# EAGLE design OV7670_VGA_FPGA_board (EAGLE 9.6.2)
COMPANY: Adafruit Industries; DRAWN: KTOWN; REV: A; YEAR: 2018

## Sheet 1 of 2
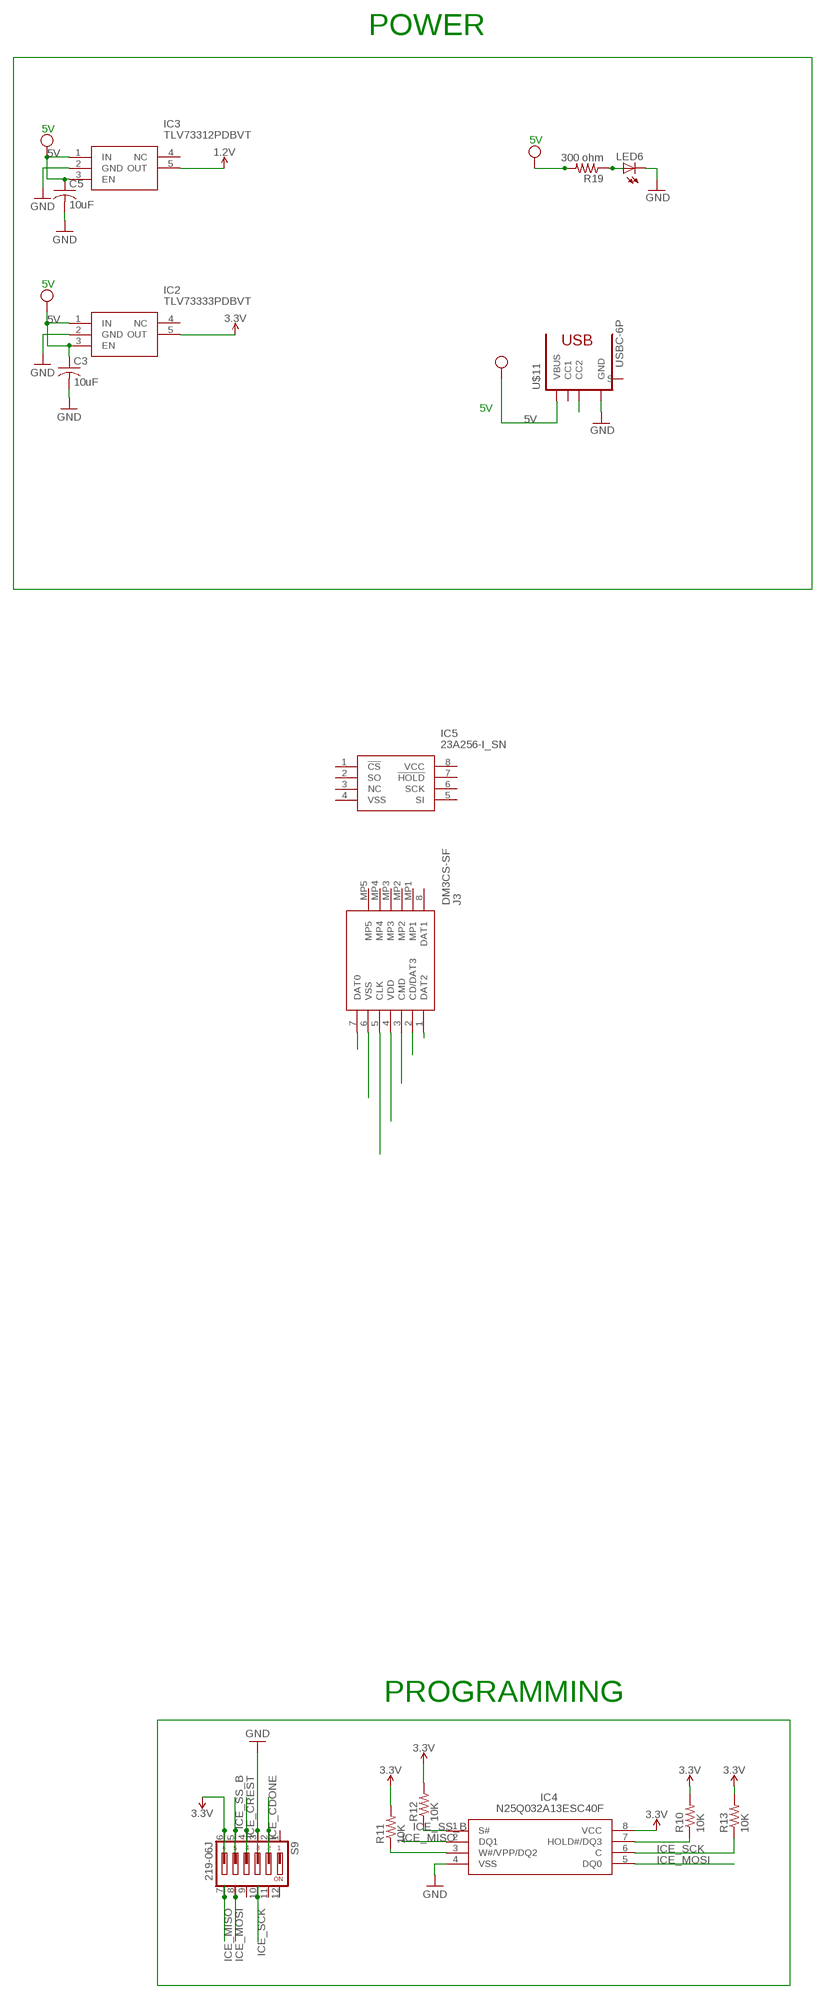
[diagram p0: schematic, sheet 1, part 1 of 3]
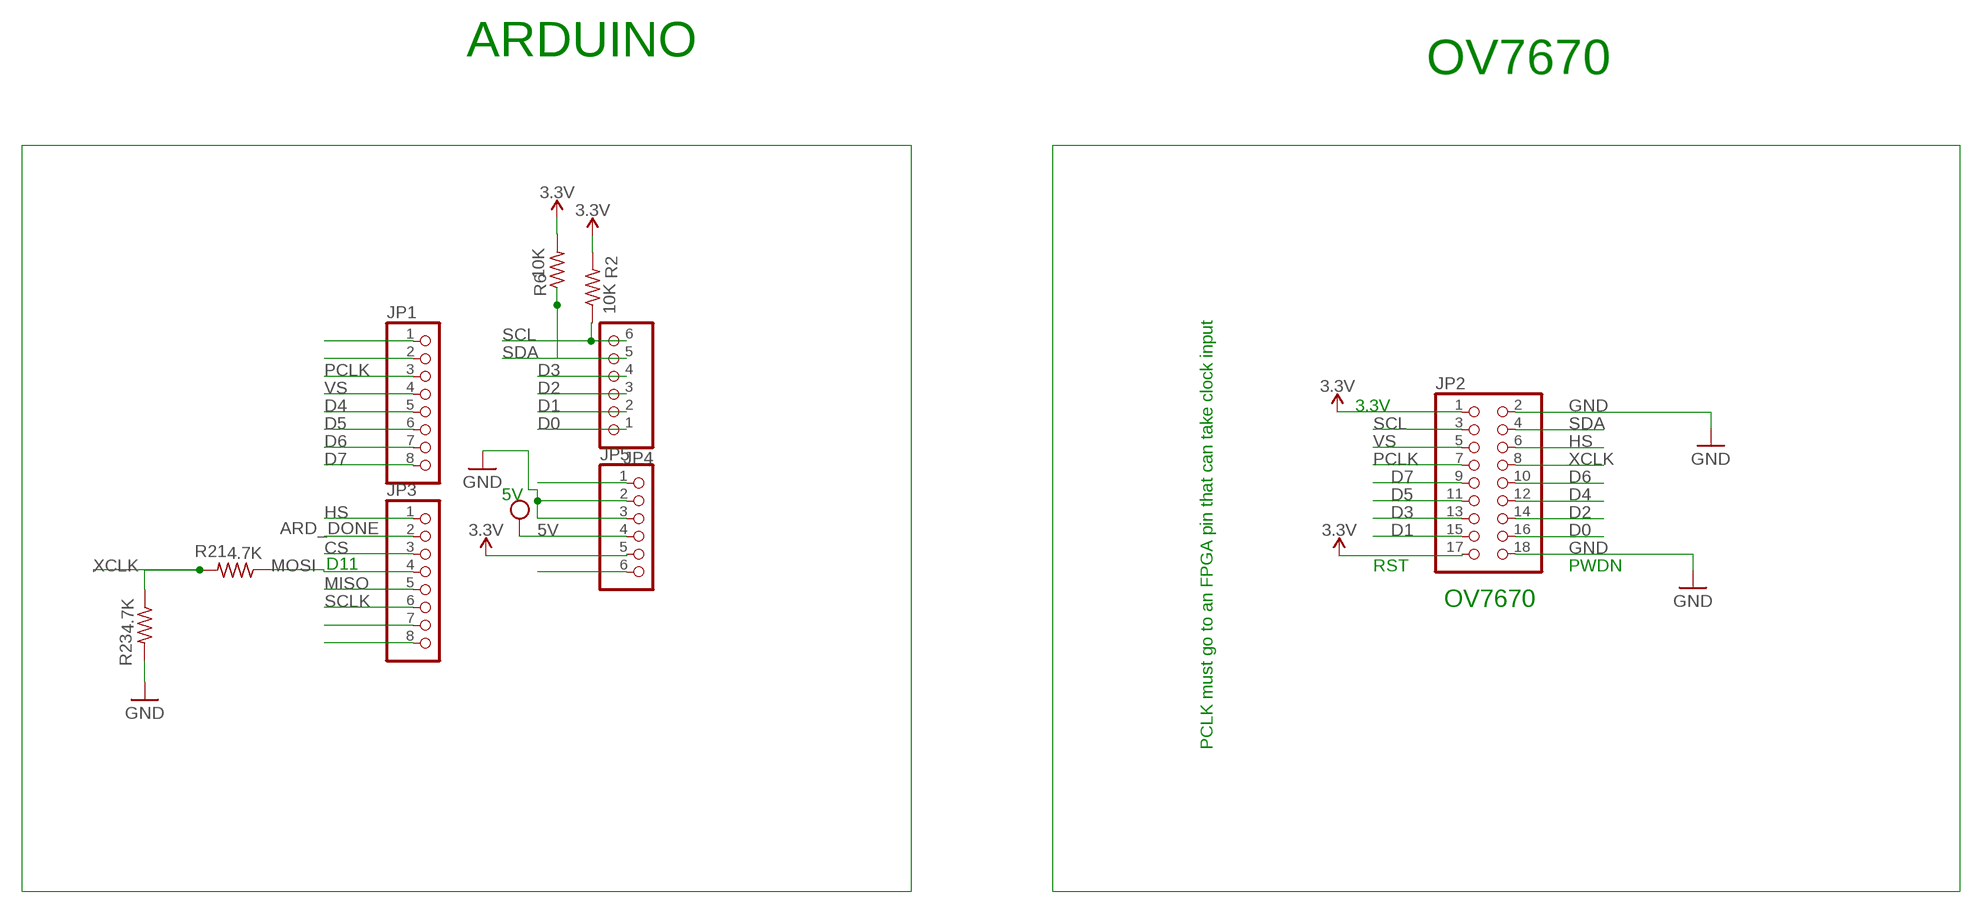
[diagram p1: schematic, sheet 1, part 2 of 3]
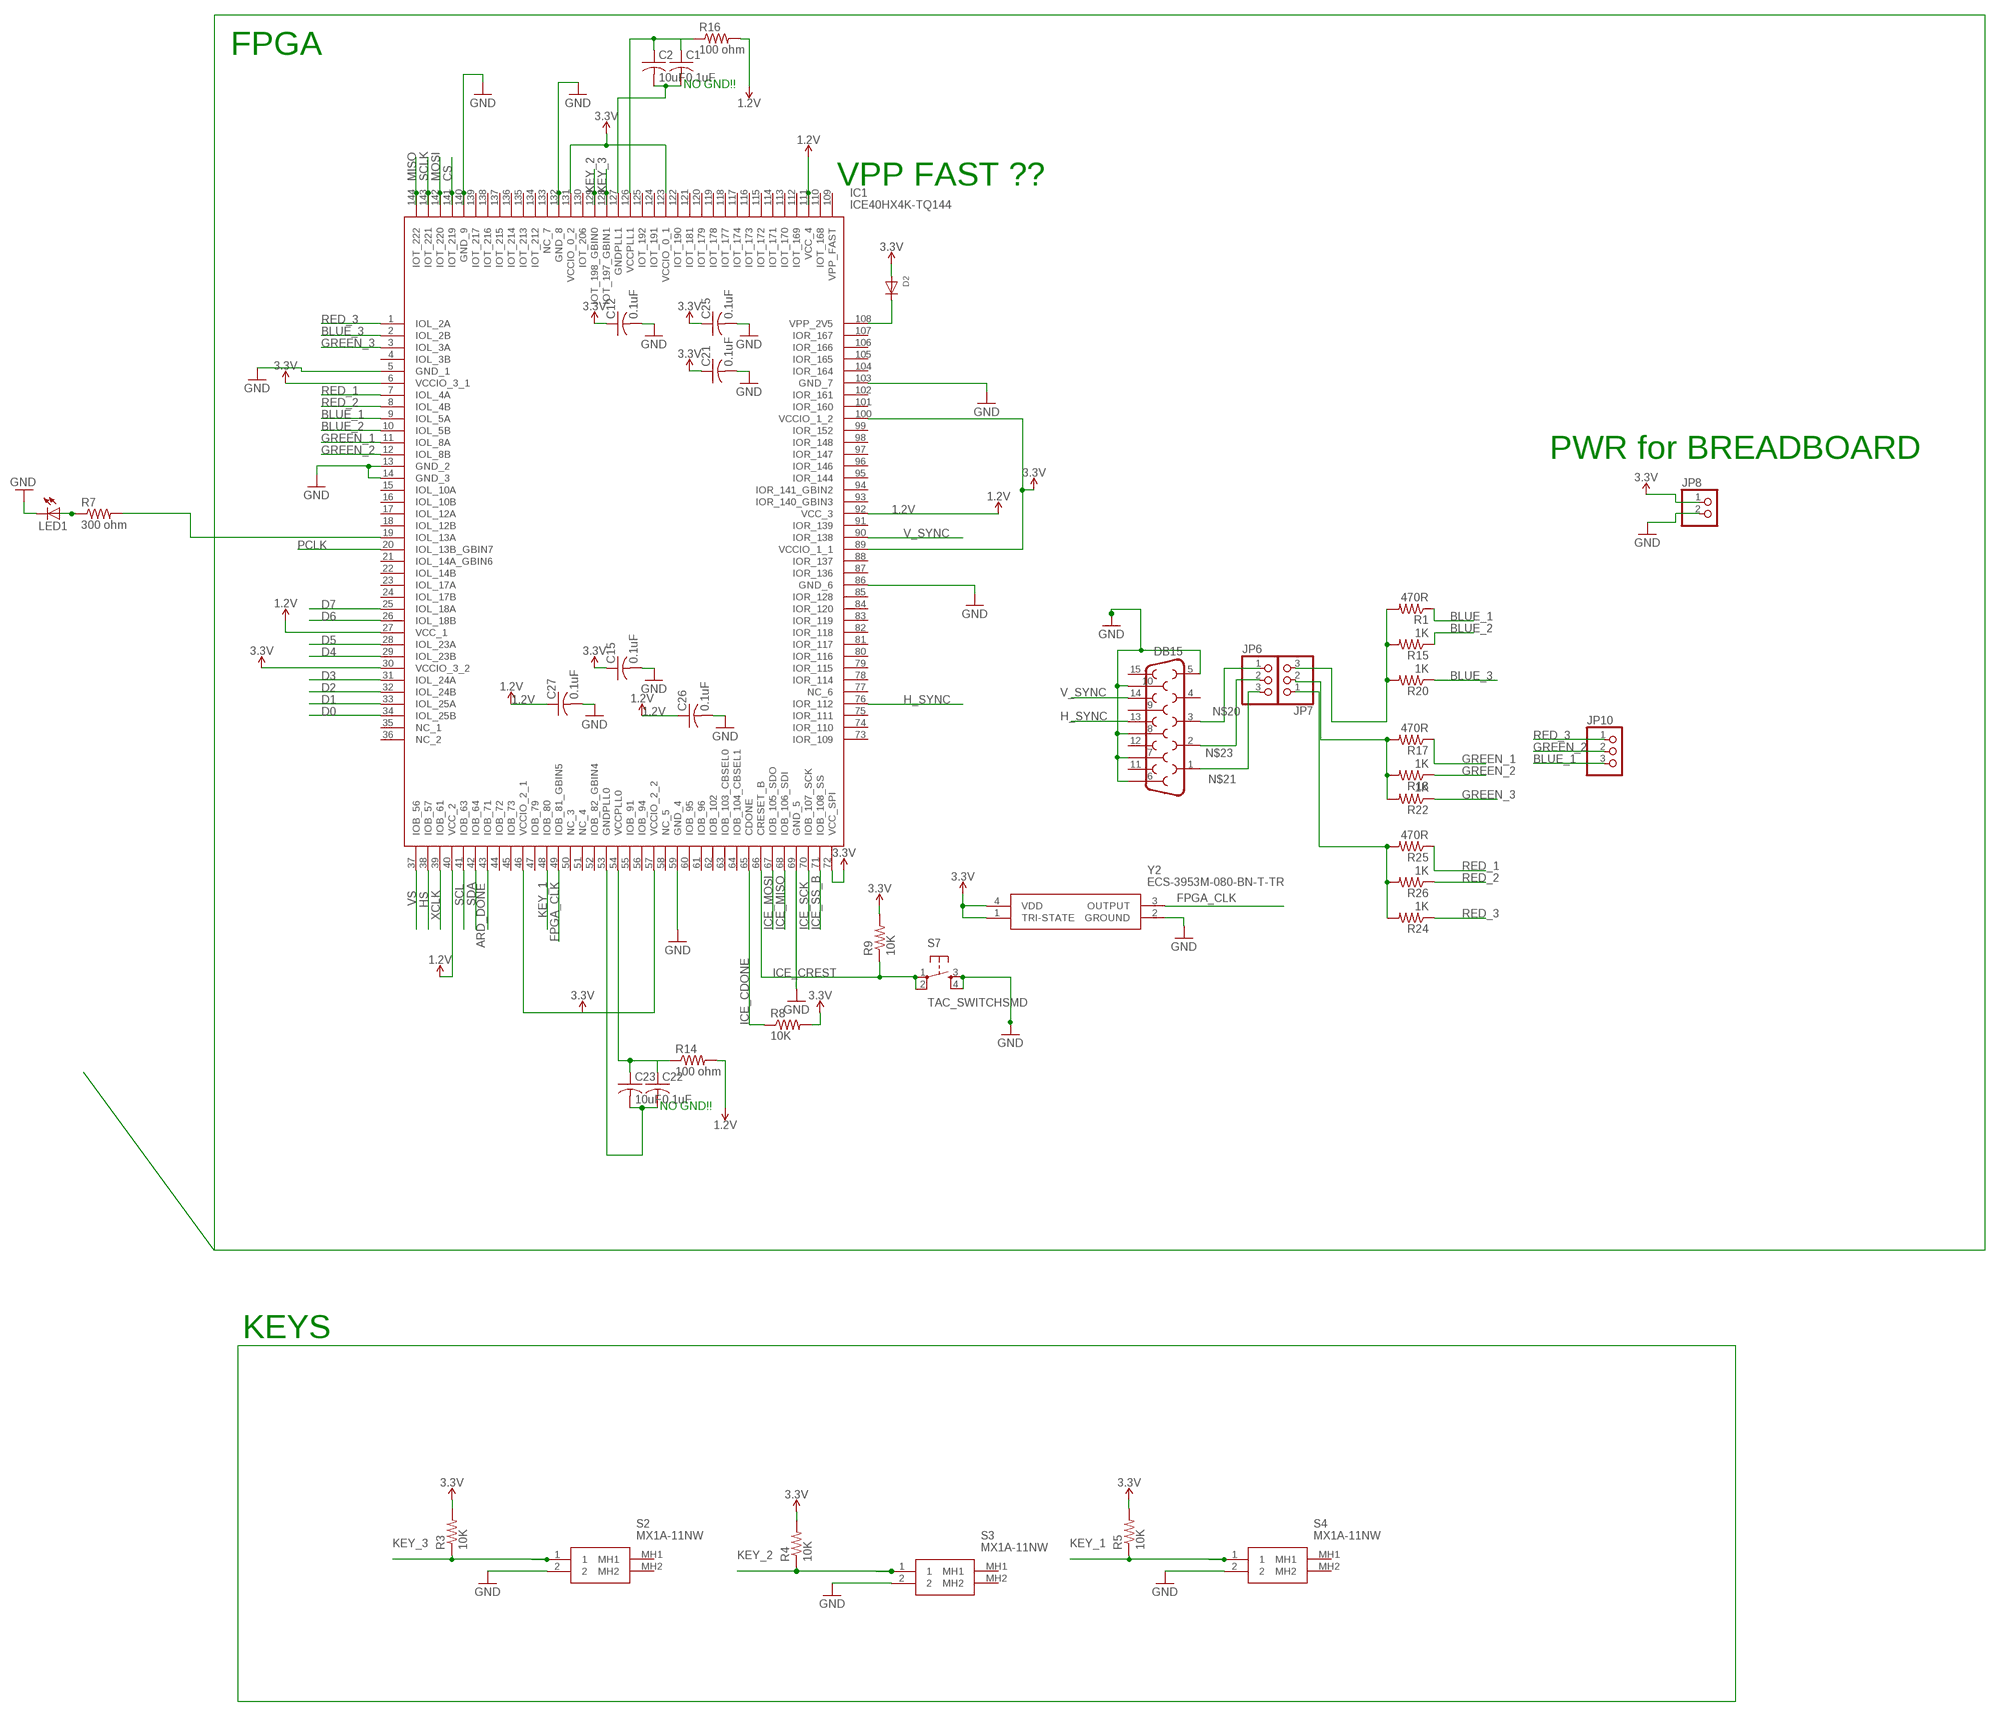
[diagram p2: schematic, sheet 1, part 3 of 3]

### Parts
C1  0.1uF  C-USC0805  [C0805]
C2  10uF  C-USC0805  [C0805]
C3  10uF  C-USC0805  [C0805]
C5  10uF  C-USC0805  [C0805]
C12  0.1uF  C-USC0805  [C0805]
C15  0.1uF  C-USC0805  [C0805]
C21  0.1uF  C-USC0805  [C0805]
C22  0.1uF  C-USC0805  [C0805]
C23  10uF  C-USC0805  [C0805]
C25  0.1uF  C-USC0805  [C0805]
C26  0.1uF  C-USC0805  [C0805]
C27  0.1uF  C-USC0805  [C0805]
D2  DIODESOD-323F  [SOD-323F]
IC1  ICE40HX4K-TQ144  [QFP50P2200X2200X160-144N]
IC2  TLV73333PDBVT  [SOT95P280X145-5N]
IC3  TLV73312PDBVT  [SOT95P280X145-5N]
IC4  N25Q032A13ESC40F  [SOIC127P600X175-8N]
IC5  23A256-I_SN  [SOIC127P600X175-8N]
J3  DM3CS-SF  [DM3CSSF]
JP1  PINHD-1X8CLEANBIG  [1X08-CLEANBIG]
JP2  PINHD-2X9/90  [2X09/90]
JP3  PINHD-1X8CLEANBIG  [1X08-CLEANBIG]
JP4  PINHD-1X6CB  [1X06-CLEANBIG]
JP5  PINHD-1X6CB  [1X06-CLEANBIG]
JP6  PINHD-1X3  [1X03]
JP7  PINHD-1X3  [1X03]
JP8  PINHD-1X2  [1X02]
JP10  PINHD-1X3  [1X03]
LED1  LEDCHIPLED_0805  [CHIPLED_0805]
LED6  LEDCHIPLED_0805  [CHIPLED_0805]
R1  470R  R-US_R0805  [R0805]
R2  10K  R-US_R0805  [R0805]
R3  10K  R-US_R0805  [R0805]
R4  10K  R-US_R0805  [R0805]
R5  10K  R-US_R0805  [R0805]
R6  10K  R-US_R0805  [R0805]
R7  300 ohm  R-US_R0805  [R0805]
R8  10K  R-US_R0805  [R0805]
R9  10K  R-US_R0805  [R0805]
R10  10K  R-US_R0805  [R0805]
R11  10K  R-US_R0805  [R0805]
R12  10K  R-US_R0805  [R0805]
R13  10K  R-US_R0805  [R0805]
R14  100 ohm  R-US_R0805  [R0805]
R15  1K  R-US_R0805  [R0805]
R16  100 ohm  R-US_R0805  [R0805]
R17  470R  R-US_R0805  [R0805]
R18  1K  R-US_R0805  [R0805]
R19  300 ohm  R-US_R0805  [R0805]
R20  1K  R-US_R0805  [R0805]
R21  4.7K  R-US_R0805  [R0805]
R22  1K  R-US_R0805  [R0805]
R23  4.7K  R-US_R0805  [R0805]
R24  1K  R-US_R0805  [R0805]
R25  470R  R-US_R0805  [R0805]
R26  1K  R-US_R0805  [R0805]
S2  MX1A-11NW  [MX1A11NW]
S3  MX1A-11NW  [MX1A11NW]
S4  MX1A-11NW  [MX1A11NW]
S7  TAC_SWITCHSMD  [TACTILE-SWITCH-SMD]
S9  219-06J  [CTS-219-06J]
U$1  DB15  [DB15]
U$11  USBC-6P  [USCX-06FX-XXMX-01]
Y2  ECS-3953M-080-BN-T-TR  [ECS3953M080BNTTR]

### Nets
1.2V: C26.1 C27.1 IC1.27(VCC_1) IC1.40(VCC_2) IC1.92(VCC_3) IC1.111(VCC_4) IC3.5(OUT) R14.2 R16.2
3.3V: C12.1 C15.1 C21.1 C25.1 D2.A IC1.6(VCCIO_3_1) IC1.30(VCCIO_3_2) IC1.46(VCCIO_2_1) IC1.57(VCCIO_2_2) IC1.72(VCC_SPI) IC1.89(VCCIO_1_1) IC1.100(VCCIO_1_2) IC1.123(VCCIO_0_1) IC1.131(VCCIO_0_2) IC2.5(OUT) IC4.8(VCC) JP2.1 JP2.17 JP5.5 JP8.1 R2.2 R3.2 R4.2 R5.2 R6.2 R8.2 R9.2 R10.2 R11.2 R12.2 R13.2 S9.6 Y2.1(TRI-STATE) Y2.4(VDD)
3.3V1: J3.4(VDD)
5V: C3.1 C5.1 IC2.1(IN) IC2.3(EN) IC3.1(IN) IC3.3(EN) JP5.4 R19.2 U$11.VBUS1(VBUS) U$11.VBUS2(VBUS) ; supply symbol labelled VCC
ARD_DONE: IC1.43(IOB_71) JP3.2
BLUE: JP7.3 R1.2 R15.2 R20.2
BLUE_1: IC1.9(IOL_5A) JP10.3 R1.1
BLUE_2: IC1.10(IOL_5B) R15.1
BLUE_3: IC1.2(IOL_2B) R20.1
CMD: J3.3(CMD)
CS: IC1.141(IOT_219) JP3.3
D0: IC1.34(IOL_25B) JP2.16 JP4.1
D1: IC1.33(IOL_25A) JP2.15 JP4.2
D2: IC1.32(IOL_24B) JP2.14 JP4.3
D3: IC1.31(IOL_24A) JP2.13 JP4.4
D4: IC1.29(IOL_23B) JP1.5 JP2.12
D5: IC1.28(IOL_23A) JP1.6 JP2.11
D6: IC1.26(IOL_18B) JP1.7 JP2.10
D7: IC1.25(IOL_18A) JP1.8 JP2.9
DAT0: J3.7(DAT0)
DAT2: J3.1(DAT2)
DAT3: J3.2(CD/DAT3)
FPGA_CLK: IC1.49(IOB_81_GBIN5) Y2.3(OUTPUT)
GND: C3.2 C5.2 C12.2 C15.2 C21.2 C25.2 C26.2 C27.2 IC1.5(GND_1) IC1.13(GND_2) IC1.14(GND_3) IC1.59(GND_4) IC1.69(GND_5) IC1.86(GND_6) IC1.103(GND_7) IC1.132(GND_8) IC1.140(GND_9) IC2.2(GND) IC3.2(GND) IC4.4(VSS) JP2.2 JP2.18 JP5.2 JP5.3 JP8.2 LED1.C LED6.C R23.2 S2.2 S3.2 S4.2 S7.3 S7.4 S9.3 U$1.5 U$1.6 U$1.7 U$1.8 U$1.10 U$11.GND1(GND) U$11.GND2(GND) Y2.2(GROUND)
GND1: J3.6(VSS)
GREEN: JP7.2 R17.2 R18.2 R22.2
GREEN_1: IC1.11(IOL_8A) R17.1
GREEN_2: IC1.12(IOL_8B) JP10.2 R18.1
GREEN_3: IC1.3(IOL_3A) R22.1
H_SYNC: IC1.76(IOR_112) U$1.13
HS: IC1.38(IOB_57) JP2.6 JP3.1
ICE_CDONE: IC1.65(CDONE) R8.1 S9.2
ICE_CREST: IC1.66(CRESET_B) R9.1 S7.1 S7.2 S9.4
ICE_MISO: IC1.68(IOB_106_SDI) IC4.2(DQ1) S9.7
ICE_MOSI: IC1.67(IOB_105_SDO) IC4.5(DQ0) S9.8
ICE_SCK: IC1.70(IOB_107_SCK) IC4.6(C) R13.1 S9.10
ICE_SS_B: IC1.71(IOB_108_SS) IC4.1(S#) R12.1 S9.5
KEY_1: IC1.48(IOB_80) R5.1 S4.1
KEY_2: IC1.129(IOT_198_GBIN0) R4.1 S3.1
KEY_3: IC1.128(IOT_197_GBIN1) R3.1 S2.1
MISO: IC1.144(IOT_222) JP3.5
MOSI: IC1.142(IOT_220) JP3.4 R21.1
N$1: IC4.7(HOLD#/DQ3) R10.1
N$2: LED6.A R19.1
N$4: IC4.3(W#/VPP/DQ2) R11.1
N$7: JP1.1
N$9: C22.1 C23.1 IC1.54(VCCPLL0) R14.1
N$10: JP1.2
N$11: LED1.A R7.1
N$12: IC1.19(IOL_13A) R7.2
N$13: D2.C IC1.108(VPP_2V5)
N$20: JP6.1 U$1.3
N$21: JP6.3 U$1.1
N$22: C1.1 C2.1 IC1.126(VCCPLL1) R16.1
N$23: JP6.2 U$1.2
N$25: C1.2 C2.2 IC1.127(GNDPLL1)
N$26: C22.2 C23.2 IC1.53(GNDPLL0)
N$27: U$11.CC2
N$34: JP3.7
N$36: JP3.8
N$37: JP5.1
N$44: JP5.6
PCLK: IC1.20(IOL_13B_GBIN7) JP1.3 JP2.7
RED: JP7.1 R24.2 R25.2 R26.2
RED_1: IC1.7(IOL_4A) R25.1
RED_2: IC1.8(IOL_4B) R26.1
RED_3: IC1.1(IOL_2A) JP10.1 R24.1
SCL: IC1.41(IOB_63) JP2.3 JP4.6 R2.1
SCLK: IC1.143(IOT_221) JP3.6
SD_CLK: J3.5(CLK)
SDA: IC1.42(IOB_64) JP2.4 JP4.5 R6.1
V_SYNC: IC1.90(IOR_138) U$1.14
VS: IC1.37(IOB_56) JP1.4 JP2.5
XCLK: IC1.39(IOB_61) JP2.8 R21.2 R23.1
Unconnected: IC1.4(IOL_3B) IC1.15(IOL_10A) IC1.16(IOL_10B) IC1.17(IOL_12A) IC1.18(IOL_12B) IC1.21(IOL_14A_GBIN6) IC1.22(IOL_14B) IC1.23(IOL_17A) IC1.24(IOL_17B) IC1.35(NC_1) IC1.36(NC_2) IC1.44(IOB_72) IC1.45(IOB_73) IC1.47(IOB_79) IC1.50(NC_3) IC1.51(NC_4) IC1.52(IOB_82_GBIN4) IC1.55(IOB_91) IC1.56(IOB_94) IC1.58(NC_5) IC1.60(IOB_95) IC1.61(IOB_96) IC1.62(IOB_102) IC1.63(IOB_103_CBSEL0) IC1.64(IOB_104_CBSEL1) IC1.73(IOR_109) IC1.74(IOR_110) IC1.75(IOR_111) IC1.77(NC_6) IC1.78(IOR_114) IC1.79(IOR_115) IC1.80(IOR_116) IC1.81(IOR_117) IC1.82(IOR_118) IC1.83(IOR_119) IC1.84(IOR_120) IC1.85(IOR_128) IC1.87(IOR_136) IC1.88(IOR_137) IC1.91(IOR_139) IC1.93(IOR_140_GBIN3) IC1.94(IOR_141_GBIN2) IC1.95(IOR_144) IC1.96(IOR_146) IC1.97(IOR_147) IC1.98(IOR_148) IC1.99(IOR_152) IC1.101(IOR_160) IC1.102(IOR_161) IC1.104(IOR_164) IC1.105(IOR_165) IC1.106(IOR_166) IC1.107(IOR_167) IC1.109(VPP_FAST) IC1.110(IOT_168) IC1.112(IOT_169) IC1.113(IOT_170) IC1.114(IOT_171) IC1.115(IOT_172) IC1.116(IOT_173) IC1.117(IOT_174) IC1.118(IOT_177) IC1.119(IOT_178) IC1.120(IOT_179) IC1.121(IOT_181) IC1.122(IOT_190) IC1.124(IOT_191) IC1.125(IOT_192) IC1.130(IOT_206) IC1.133(NC_7) IC1.134(IOT_212) IC1.135(IOT_213) IC1.136(IOT_214) IC1.137(IOT_215) IC1.138(IOT_216) IC1.139(IOT_217) IC2.4(NC) IC3.4(NC) IC5.1(!CS) IC5.2(SO) IC5.3(NC) IC5.4(VSS) IC5.5(SI) IC5.6(SCK) IC5.7(!HOLD) IC5.8(VCC) J3.8(DAT1) J3.MP1 J3.MP2 J3.MP3 J3.MP4 J3.MP5 S2.MH1 S2.MH2 S3.MH1 S3.MH2 S4.MH1 S4.MH2 S9.1 S9.9 S9.11 S9.12 U$1.4 U$1.9 U$1.11 U$1.12 U$1.15 U$11.CC1 U$11.SHIELD1(S) U$11.SHIELD2(S) U$11.SHIELD3(S) U$11.SHIELD4(S)

### Notes on the sheet
- POWER
- ARDUINO
- OV7670
- 5V
- 5V
- 5V
- 3.3V
- 5V
- D11 | RST | PWDN
- 5V
- OV7670
- PCLK must go to an FPGA pin that can take clock input
- FPGA
- NO GND!!
- VPP FAST ??
- PWR for BREADBOARD
- NO GND!!
- PROGRAMMING
- KEYS

## Sheet 2 of 2

## Library data of the parts
C1-C3 C5 C12 C15 C21-C23 C25-C27 = adafruit:C-US: CAPACITOR, American symbol
D2 = adafruit:DIODE: Diode SMADIODE - SMA Surface Mount Package 20V 1A Schottky Diode Digikey: 641-1014-6-ND DO-1N4148 - Through Hole Small Current Diode SOD-123 20V 1 A (.5mV Vf) Schottky Diode - Digikey: MBRX120TPMSCT-ND SOD-323 10V 570mA (.38mV Vf, 3ns) Schottky Diode - Digikey: ZLLS410CT-ND SOD-523 30V 30mA Schottky Diode (RB751S-40TE61) - Digikey: RB751S-40TE61CT-ND SOT23-R/W - SOT23 Package (R = Solder Paste/Reflow Ovens, W = Hand-Soldering) BAT54Film 40V 300mA - Digikey: 497-7162-1-ND
IC1 = iCE40HX4K-TQ144:ICE40HX4K-TQ144: FPGA - Field Programmable Gate Array Source: Datasheet <https://componentsearchengine.com/Datasheets/1/iCE40HX4K-TQ144.pdf>; DESCRIPTION: FPGA - Field Programmable Gate Array; HEIGHT: 1.6mm; MANUFACTURER_NAME: Lattice Semiconductor; MANUFACTURER_PART_NUMBER: iCE40HX4K-TQ144; MOUSER_PART_NUMBER: 842-ICE40HX4K-TQ144; MOUSER_PRICE-STOCK: https://www.mouser.co.uk/ProductDetail/Lattice/iCE40HX4K-TQ144?qs=F9A14TELRMvGNTZXkNDuOw%3D%3D
IC2 = TLV73333PDBVT:TLV73333PDBVT: Capacitor-free 300-mA low-dropout (LDO) regulator with foldback current limit for portable devices Source: Datasheet <http://www.ti.com/lit/ds/symlink/tlv733p.pdf>; DESCRIPTION: Capacitor-free 300-mA low-dropout (LDO) regulator with foldback current limit for portable devices; HEIGHT: 1.45mm; MANUFACTURER_NAME: Texas Instruments; MANUFACTURER_PART_NUMBER: TLV73333PDBVT; MOUSER_PART_NUMBER: 595-TLV73333PDBVT; MOUSER_PRICE-STOCK: https://www.mouser.co.uk/ProductDetail/Texas-Instruments/TLV73333PDBVT?qs=ifm8N2Kdrcam8xfmi4tOsQ%3D%3D
IC3 = TLV73312PDBVT:TLV73312PDBVT: Capacitor-free 300-mA low-dropout (LDO) regulator with foldback current limit for portable devices Source: Datasheet <http://www.ti.com/lit/gpn/TLV733P>; DESCRIPTION: Capacitor-free 300-mA low-dropout (LDO) regulator with foldback current limit for portable devices; HEIGHT: 1.45mm; MANUFACTURER_NAME: Texas Instruments; MANUFACTURER_PART_NUMBER: TLV73312PDBVT; MOUSER_PART_NUMBER: 595-TLV73312PDBVT; MOUSER_PRICE-STOCK: https://www.mouser.co.uk/ProductDetail/Texas-Instruments/TLV73312PDBVT?qs=ifm8N2KdrcbA2G38xADqCw%3D%3D
IC4 = N25Q032A13ESC40F:N25Q032A13ESC40F: FLASH - NOR Memory IC 32Mb (8M x 4) SPI 108MHz 8-SO Source: Datasheet <https://media-www.micron.com/-/media/client/global/documents/products/data-sheet/nor-flash/serial-nor/n25q/n25q_32mb_3v_65nm.pdf?rev=27fc6016fc5249adb4bb8f221e72b395>; DESCRIPTION: FLASH - NOR Memory IC 32Mb (8M x 4) SPI 108MHz 8-SO; HEIGHT: 1.75mm; MANUFACTURER_NAME: Alliance Memory; MANUFACTURER_PART_NUMBER: N25Q032A13ESC40F; MOUSER_PART_NUMBER: 913-N25Q032A13ESC40F; MOUSER_PRICE-STOCK: https://www.mouser.co.uk/ProductDetail/Alliance-Memory/N25Q032A13ESC40F?qs=W%2FMpXkg%252BdQ70%2FmLJsMq3Ww%3D%3D
IC5 = 23A256-I_SN:23A256-I_SN: 256K,32K X 8 1.7V Ser SRAM,23A256-I/SN Source: Datasheet <https://componentsearchengine.com/Datasheets/1/23A256-I_SN.pdf>; DESCRIPTION: 256K,32K X 8 1.7V Ser SRAM,23A256-I/SN; HEIGHT: 1.75mm; MANUFACTURER_NAME: Microchip; MANUFACTURER_PART_NUMBER: 23A256-I/SN; MOUSER_PART_NUMBER: 579-23A256-I/SN; MOUSER_PRICE-STOCK: https://www.mouser.com/Search/Refine.aspx?Keyword=579-23A256-I%2FSN
J3 = DM3CS-SF:DM3CS-SF: Memory Card Connectors 8P R/A SMT MICRO SD HINGE PUSH-PULL Source: Datasheet <https://datasheet.lcsc.com/szlcsc/Hirose-HRS-DM3CS-SF_C202111.pdf>; DESCRIPTION: Memory Card Connectors 8P R/A SMT MICRO SD HINGE PUSH-PULL; HEIGHT: 1.83mm; MANUFACTURER_NAME: Hirose; MANUFACTURER_PART_NUMBER: DM3CS-SF; MOUSER_PART_NUMBER: 798-DM3CSSF; MOUSER_PRICE-STOCK: https://www.mouser.co.uk/ProductDetail/Hirose-Connector/DM3CS-SF?qs=tTj%252BmQ3KZwbB9K5zh89Rcw%3D%3D
JP1 JP3 = adafruit:PINHD-1X8: PIN HEADER
JP2 = pinhead:PINHD-2X9: PIN HEADER
JP4 JP5 = adafruit:PINHD-1X6: PIN HEADER
JP6 JP7 JP10 = adafruit:PINHD-1X3: PIN HEADER
JP8 = pinhead:PINHD-1X2: PIN HEADER
LED1 LED6 = adafruit:LED: LED OSRAM: - CHIPLED LG R971, LG N971, LY N971, LG Q971, LY Q971, LO R971, LY R971 LH N974, LH R974 LS Q976, LO Q976, LY Q976 LO Q996 - Hyper CHIPLED LW Q18S LB Q993, LB Q99A, LB R99A - SideLED LS A670, LO A670, LY A670, LG A670, LP A670 LB A673, LV A673, LT A673, LW A673 LH A674 LY A675 LS A676, LA A676, LO A676, LY A676, LW A676 LS A679, LY A679, LG A679 - Hyper Micro SIDELED® LS Y876, LA Y876, LO Y876, LY Y876 LT Y87S - SmartLED LW L88C, LW L88S LB L89C, LB L89S, LG L890 LS L89K, LO L89K, LY L89K LS L896, LA L896, LO L896, LY L896 - TOPLED LS T670, LO T670, LY T670, LG T670, LP T670 LSG T670, LSP T670, LSY T670, LOP T670, LYG T670 LG T671, LOG T671, LSG T671 LB T673, LV T673, LT T673, LW T673 LH T674 LS T676, LA T676, LO T676, LY T676, LB T676, LH T676, LSB T676, LW T676 LB T67C, LV T67C, LT T67C, LS T67K, LO T67K, LY T67K, LW E67C LS E67B, LA E67B, LO E67B, LY E67B, LB E67C, LV E67C, LT E67C LW T67C LS T679, LY T679, LG T679 LS T770, LO T770, LY T770, LG T770, LP T770 LB T773, LV T773, LT T773, LW T773 LH T774 LS E675, LA E675, LY E675, LS T675 LS T776, LA T776, LO T776, LY T776, LB T776 LHGB T686 LT T68C, LB T68C - Hyper Mini TOPLED® LB M676 - Mini TOPLED Santana® LG M470 LS M47K, LO M47K, LY M47K Source: http://www.osram.convergy.de/
R1-R26 = adafruit:R-US_: RESISTOR, American symbol
S2-S4 = MX1A-11NW:MX1A-11NW: CHERRY - MX1A-11NW - Tactile Switch, MX Series, Top Actuated, Surface Mount, Plunger for Cap, 59.5 gf, 10mA at 12VDC Source: Datasheet <https://media.digikey.com/pdf/Data Sheets/Cherry PDFs/MX Series.pdf>; DESCRIPTION: CHERRY - MX1A-11NW - Tactile Switch, MX Series, Top Actuated, Surface Mount, Plunger for Cap, 59.5 gf, 10mA at 12VDC; HEIGHT: 15.2mm; MANUFACTURER_NAME: Cherry; MANUFACTURER_PART_NUMBER: MX1A-11NW; MOUSER_PART_NUMBER: 540-MX1A-11NW; MOUSER_PRICE-STOCK: https://www.mouser.co.uk/ProductDetail/CHERRY/MX1A-11NW?qs=5iusCjFLgR7487Rvpe7dvw%3D%3D
S7 = SparkFun-Retired:TAC_SWITCH: Momentary Switch Button commonly used for reset or general input. Spark Fun Electronics SKU : COM-00097 SMT- SWCH-08247; PROD_ID: SWCH-08247
S9 = switch-dil:219-06*: Surface Mount DIP Switch Series 219 SMT CTS Electronic Components Sourc: www.ctscorp.com; OC_FARNELL: unknown; OC_NEWARK: unknown
U$1 = SparkFun-Retired:DB15: DB15 / VGA right angle through-hole female connector.
U$11 = USBC6P:USBC-6P: AliExpress Special! Connect 5.1k 10% resistors to each CC pin, pulled up to 3.3v or 5.0v.
Y2 = ECS-3953M-080-BN-T-TR:ECS-3953M-080-BN-T-TR: Standard Clock Oscillators 8.000 MHZ 3.3 VOLT SMD 50PPM-40+85 45/55 7050 T&R OSC Source: Datasheet <https://ecsxtal.com/store/pdf/ecs-3951m-bn-3953m-bn.pdf>; DESCRIPTION: Standard Clock Oscillators 8.000 MHZ 3.3 VOLT SMD 50PPM-40+85 45/55 7050 T&R OSC; HEIGHT: 1.7mm; MANUFACTURER_NAME: ECS; MANUFACTURER_PART_NUMBER: ECS-3953M-080-BN-T-TR

## Board
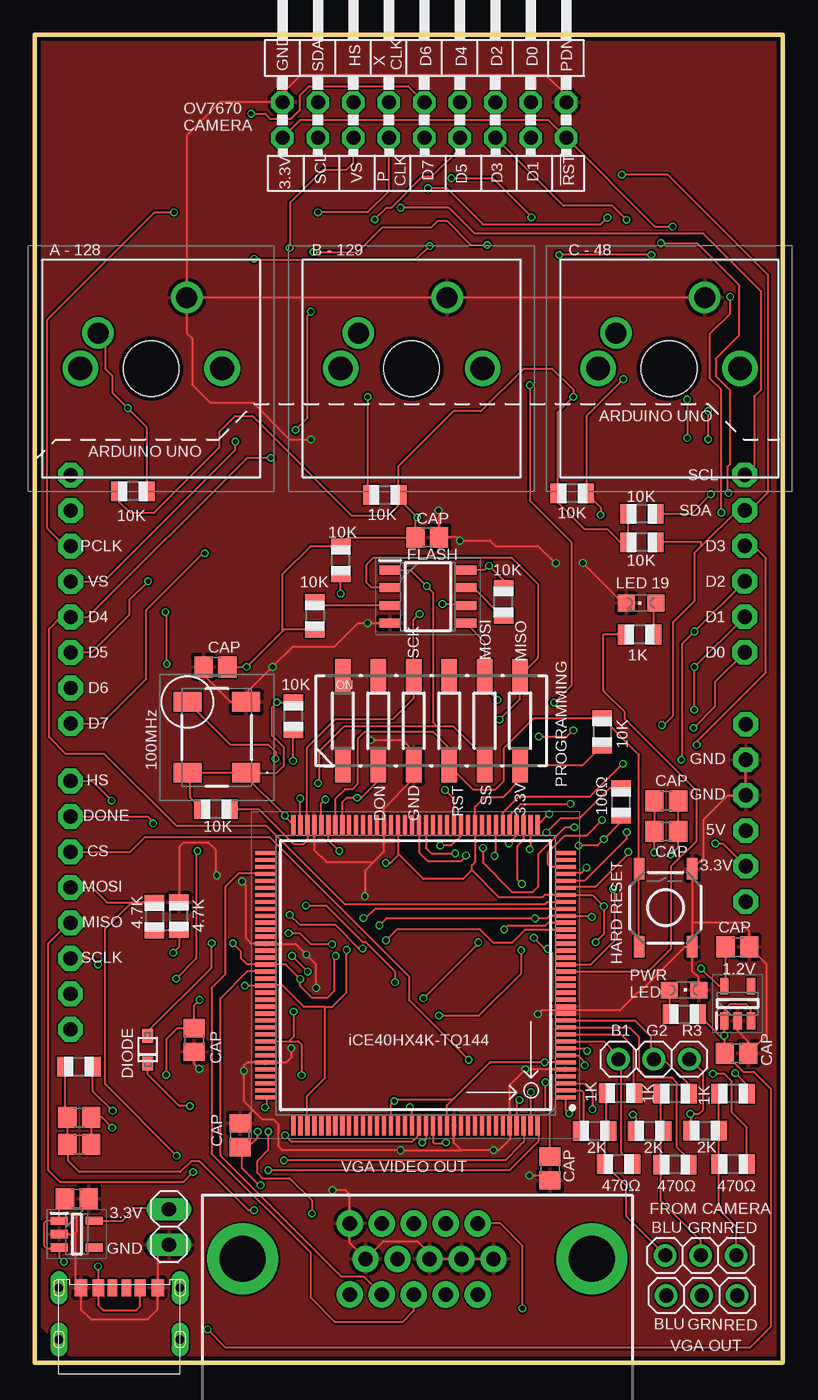
[diagram p3: board, top side]
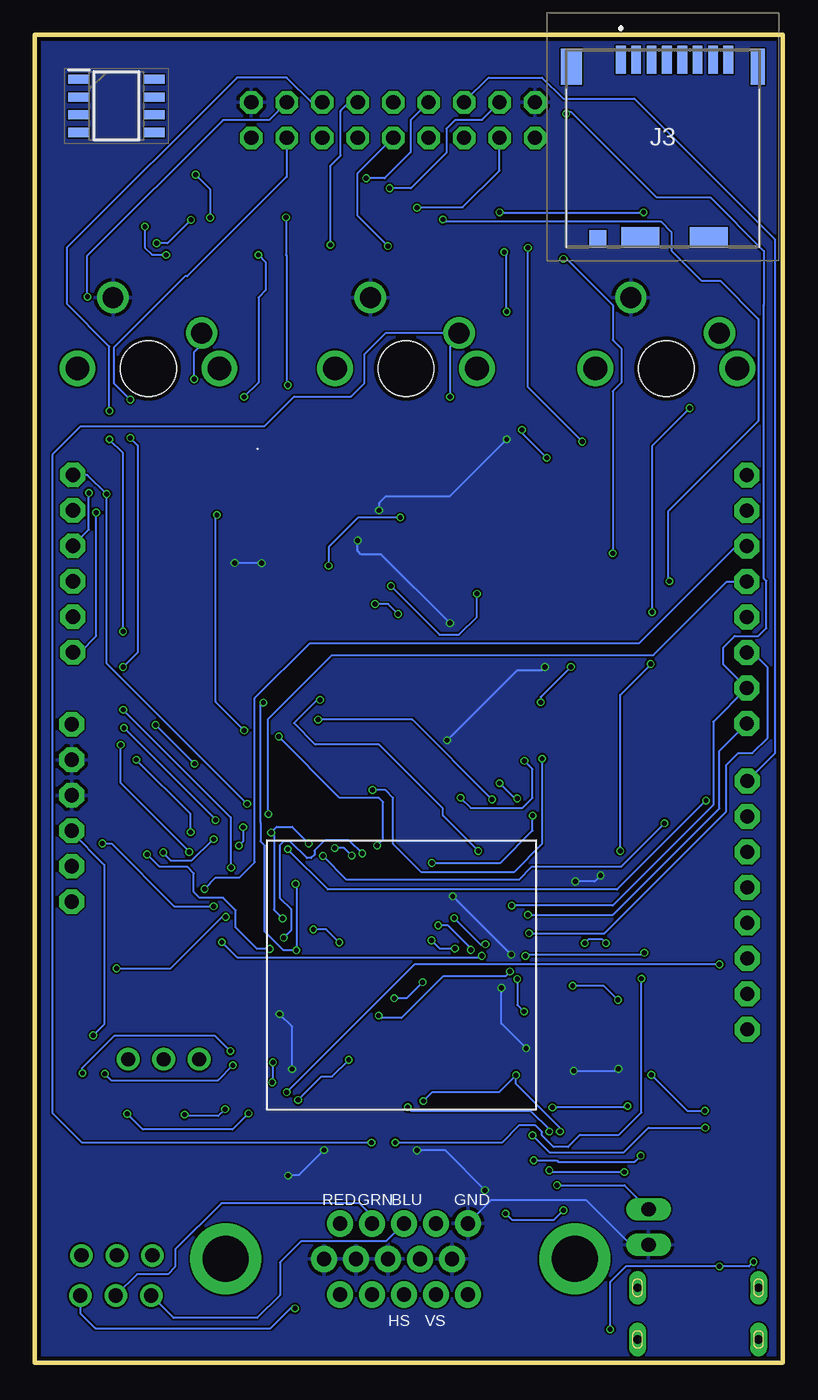
[diagram p4: board, bottom side, seen from below]

Size 53.54 x 95.05 mm. Coordinates in mm from the lower left corner, seen from the top.
Outline: 0,95.05 53.54,95.05 53.54,0 0,0 0,95.05
Copper layers (1*16): Top 0.035mm / dielectric 1.5mm / Bottom 0.035mm
Design rules "aisler_2_layer_complex": minimum track width 0.125mm, minimum drill 0.25mm, track to track 0.125mm, track to pad 0.125mm, pad to pad 0.125mm, via to via 0.125mm, smd to smd 0mil, copper to edge 0.3mm, drill to drill 0.3mm, minimum pad ring 0.3mm, minimum via ring 0.1mm, stop-mask expansion 0mil, vias tented up to drill 0mil, thermal gap 10mil

### Footprints (pad centres in the part's own frame; a part is rotated, then mirrored left to right if it is on the bottom)
C0805 = smd 1.3 x 1.5: 1 -0.85,0; 2 0.85,0
SOD-323F = smd 1 x 0.8: A -1,0; C 1,0
QFP50P2200X2200X160-144N = smd 1.475 x 0.3: 1 -10.738,8.75; 2 -10.738,8.25; 3 -10.738,7.75; 4 -10.738,7.25; 5 -10.738,6.75; 6 -10.738,6.25; 7 -10.738,5.75; 8 -10.738,5.25; 9 -10.738,4.75; 10 -10.738,4.25; 11 -10.738,3.75; 12 -10.738,3.25; 13 -10.738,2.75; 14 -10.738,2.25; 15 -10.738,1.75; 16 -10.738,1.25; 17 -10.738,0.75; 18 -10.738,0.25; 19 -10.738,-0.25; 20 -10.738,-0.75; 21 -10.738,-1.25; 22 -10.738,-1.75; 23 -10.738,-2.25; 24 -10.738,-2.75; 25 -10.738,-3.25; 26 -10.738,-3.75; 27 -10.738,-4.25; 28 -10.738,-4.75; 29 -10.738,-5.25; 30 -10.738,-5.75; 31 -10.738,-6.25; 32 -10.738,-6.75; 33 -10.738,-7.25; 34 -10.738,-7.75; 35 -10.738,-8.25; 36 -10.738,-8.75; 73 10.738,-8.75; 74 10.738,-8.25; 75 10.738,-7.75; 76 10.738,-7.25; 77 10.738,-6.75; 78 10.738,-6.25; 79 10.738,-5.75; 80 10.738,-5.25; 81 10.738,-4.75; 82 10.738,-4.25; 83 10.738,-3.75; 84 10.738,-3.25; 85 10.738,-2.75; 86 10.738,-2.25; 87 10.738,-1.75; 88 10.738,-1.25; 89 10.738,-0.75; 90 10.738,-0.25; 91 10.738,0.25; 92 10.738,0.75; 93 10.738,1.25; 94 10.738,1.75; 95 10.738,2.25; 96 10.738,2.75; 97 10.738,3.25; 98 10.738,3.75; 99 10.738,4.25; 100 10.738,4.75; 101 10.738,5.25; 102 10.738,5.75; 103 10.738,6.25; 104 10.738,6.75; 105 10.738,7.25; 106 10.738,7.75; 107 10.738,8.25; 108 10.738,8.75 | smd 0.3 x 1.475: 37 -8.75,-10.738; 38 -8.25,-10.738; 39 -7.75,-10.738; 40 -7.25,-10.738; 41 -6.75,-10.738; 42 -6.25,-10.738; 43 -5.75,-10.738; 44 -5.25,-10.738; 45 -4.75,-10.738; 46 -4.25,-10.738; 47 -3.75,-10.738; 48 -3.25,-10.738; 49 -2.75,-10.738; 50 -2.25,-10.738; 51 -1.75,-10.738; 52 -1.25,-10.738; 53 -0.75,-10.738; 54 -0.25,-10.738; 55 0.25,-10.738; 56 0.75,-10.738; 57 1.25,-10.738; 58 1.75,-10.738; 59 2.25,-10.738; 60 2.75,-10.738; 61 3.25,-10.738; 62 3.75,-10.738; 63 4.25,-10.738; 64 4.75,-10.738; 65 5.25,-10.738; 66 5.75,-10.738; 67 6.25,-10.738; 68 6.75,-10.738; 69 7.25,-10.738; 70 7.75,-10.738; 71 8.25,-10.738; 72 8.75,-10.738; 109 8.75,10.738; 110 8.25,10.738; 111 7.75,10.738; 112 7.25,10.738; 113 6.75,10.738; 114 6.25,10.738; 115 5.75,10.738; 116 5.25,10.738; 117 4.75,10.738; 118 4.25,10.738; 119 3.75,10.738; 120 3.25,10.738; 121 2.75,10.738; 122 2.25,10.738; 123 1.75,10.738; 124 1.25,10.738; 125 0.75,10.738; 126 0.25,10.738; 127 -0.25,10.738; 128 -0.75,10.738; 129 -1.25,10.738; 130 -1.75,10.738; 131 -2.25,10.738; 132 -2.75,10.738; 133 -3.25,10.738; 134 -3.75,10.738; 135 -4.25,10.738; 136 -4.75,10.738; 137 -5.25,10.738; 138 -5.75,10.738; 139 -6.25,10.738; 140 -6.75,10.738; 141 -7.25,10.738; 142 -7.75,10.738; 143 -8.25,10.738; 144 -8.75,10.738
SOT95P280X145-5N = smd 1.2 x 0.6: 1 -1.25,0.95; 2 -1.25,0; 3 -1.25,-0.95; 4 1.25,-0.95; 5 1.25,0.95
SOIC127P600X175-8N = smd 1.525 x 0.65: 1 -2.712,1.905; 2 -2.712,0.635; 3 -2.712,-0.635; 4 -2.712,-1.905; 5 2.712,-1.905; 6 2.712,-0.635; 7 2.712,0.635; 8 2.712,1.905
SOIC127P600X175-8N' = smd 1.5 x 0.65: 1 -2.7,1.905; 2 -2.7,0.635; 3 -2.7,-0.635; 4 -2.7,-1.905; 5 2.7,-1.905; 6 2.7,-0.635; 7 2.7,0.635; 8 2.7,1.905
DM3CSSF = smd 0.7 x 2: 1 3,-6.35; 2 1.9,-6.35; 3 0.8,-6.35; 4 -0.3,-6.35; 5 -1.4,-6.35; 6 -2.5,-6.35; 7 -3.6,-6.35; 8 -4.7,-6.35 | smd 1 x 2.6: MP1 -6.8,-5.85 | smd 1.5 x 2.6: MP2 6.55,-5.85 | smd 2.7 x 1.4: MP3 -3.3,6.35; MP4 1.6,6.35 | smd 1.2 x 1.2: MP5 4.65,6.45
1X08-CLEANBIG = drill 1.016 pad 1.778 octagon: 1 -8.89,0; 2 -6.35,0; 3 -3.81,0; 4 -1.27,0; 5 1.27,0; 6 3.81,0; 7 6.35,0; 8 8.89,0
2X09/90 = drill 1.016 octagon: 1 -10.16,-6.35; 2 -10.16,-3.81; 3 -7.62,-6.35; 4 -7.62,-3.81; 5 -5.08,-6.35; 6 -5.08,-3.81; 7 -2.54,-6.35; 8 -2.54,-3.81; 9 0,-6.35; 10 0,-3.81; 11 2.54,-6.35; 12 2.54,-3.81; 13 5.08,-6.35; 14 5.08,-3.81; 15 7.62,-6.35; 16 7.62,-3.81; 17 10.16,-6.35; 18 10.16,-3.81
1X06-CLEANBIG = drill 1.016 pad 1.778 octagon: 1 -6.35,0; 2 -3.81,0; 3 -1.27,0; 4 1.27,0; 5 3.81,0; 6 6.35,0
1X03 = drill 1.016: 1 -2.54,0; 2 0,0; 3 2.54,0
1X02 = drill 1.016 long: 1 -1.27,0; 2 1.27,0
CHIPLED_0805 = smd 1.2 x 1.2: A 0,-1.05; C 0,1.05
R0805 = smd 1.1 x 1.4: 1 -1,0; 2 1,0
MX1A11NW = drill 1.499 pad 2.248: 1 0,0; 2 6.35,2.54 | drill 1.702 pad 2.553: MH1 -1.27,-2.54; MH2 8.89,-2.54 | hole 3.988: 3.81,-2.54
TACTILE-SWITCH-SMD = smd 1.524 x 0.762: 1 -2.794,1.905; 2 2.794,1.905; 3 -2.794,-1.905; 4 2.794,-1.905
CTS-219-06J = smd 1.13 x 2.44: 1 -6.35,-3.215; 2 -3.81,-3.215; 3 -1.27,-3.215; 4 1.27,-3.215; 5 3.81,-3.215; 6 6.35,-3.215; 7 6.35,3.215; 8 3.81,3.215; 9 1.27,3.215; 10 -1.27,3.215; 11 -3.81,3.215; 12 -6.35,3.215
DB15 = drill 1.016 pad 1.88: 1 -4.32,-7.62; 2 -2.03,-7.62; 3 0.26,-7.62; 4 2.55,-7.62; 5 4.84,-7.62; 6 -5.46,-5.08; 7 -3.17,-5.08; 8 -0.88,-5.08; 9 1.41,-5.08; 10 3.7,-5.08; 11 -4.32,-2.54; 12 -2.03,-2.54; 13 0.26,-2.54; 14 2.55,-2.54; 15 4.84,-2.54 | drill 3.302 pad 5.08: G1 -12.5,-5.08; G2 12.5,-5.08
USCX-06FX-XXMX-01 = smd 0.7 x 1.2: CC1 0.5,-1.75; CC2 -0.5,-1.75 | smd 0.9 x 1.2: GND1 2.75,-1.75; GND2 -2.75,-1.75 | drill 0.6 long: SHIELD1 4.325,1.95; SHIELD2 4.325,-1.75; SHIELD3 -4.35,-1.75; SHIELD4 -4.35,1.95 | smd 0.8 x 1.2: VBUS1 1.5,-1.75; VBUS2 -1.5,-1.75
ECS3953M080BNTTR = smd 1.4 x 2: 1 -2.54,-2.1; 2 2.54,-2.1; 3 2.54,2.1; 4 -2.54,2.1

### Placement (x,y rotation side)
C1  3.17,17.55 0 top
C2  3.17,15.62 0 top
C3  3,11.73 0 top
C5  50.24,22.15 0 top
C12  36.88,13.89 270 top
C15  12.93,49.81 180 top
C21  14.68,16.28 90 top
C22  45.21,40.21 0 top
C23  45.21,38.02 0 top
C25  28.09,59.08 0 top
C26  11.4,23.09 270 top
C27  50.3,29.76 0 top
D2  8.08,22.4 270 top
IC1  27.25,27.74 180 top
IC2  3,9.19 0 top
IC3  50.32,25.7 90 top
IC4  28.14,54.84 0 top
IC5  23A256-I_SN  [SOIC127P600X175-8N']  47.7,89.97 0 bottom
J3  8.59,86.92 180 bottom
JP1  2.57,54.64 270 top
JP2  27.89,94.03 0 top
JP3  2.54,32.74 270 top
JP4  50.83,57.2 90 top
JP5  50.9,39.34 270 top
JP6  47.75,4.8 0 top
JP7  47.68,7.67 180 top
JP8  9.6,9.7 270 top
JP10  44.32,21.72 180 top
LED1  43.41,54.38 90 top
LED6  46.48,26.67 270 top
R1  41.81,14.2 180 top
R2  43.46,60.76 180 top
R3  7.01,62.38 180 top
R4  25.04,62.13 0 top
R5  38.48,62.23 180 top
R6  43.46,58.72 180 top
R7  43.31,52.12 180 top
R8  18.52,46.27 90 top
R9  40.61,45.15 270 top
R10  33.55,54.46 90 top
R11  20.05,53.47 270 top
R12  21.89,57.44 90 top
R13  12.97,39.62 180 top
R14  41.97,40.13 90 top
R15  41.94,19.28 180 top
R16  3.15,21.18 0 top
R17  45.82,14.17 180 top
R18  45.85,19.25 180 top
R19  46.5,24.94 0 top
R20  40.08,16.59 0 top
R21  8.56,31.93 270 top
R22  44.02,16.59 0 top
R23  10.31,31.95 90 top
R24  47.98,16.61 0 top
R25  49.99,14.2 180 top
R26  49.99,19.25 180 top
S2  4.52,73.71 0 top
S3  23.16,73.71 0 top
S4  41.61,73.71 0 top
S7  45.16,32.56 90 top
S9  28.4,45.95 0 top
U$1  27.38,2.34 180 top
U$11  6.05,3.61 180 top
Y2  13.03,44.75 90 top

### Tracks (layer width: path | path; a pad name or v marks a point on that pad's centre or on a via)
1.2V  (via drill 0.35)
  Top 0.152: 20.78,25.45 21.29,25.45 22.33,26.49 v22.33,29.54 | v24.66,31.29 25.17,31.8 v35.81,31.8 36.68,31.8 36.88,32.01 38.03,32.01 38.05,31.99 | C27.1 49.45,27.04 IC3.5 48.97,26.95 v47.7,28.22 | v39.88,31.9 39.78,32 39.76,31.99 38.05,31.99 | v11.79,25.96 11.4,25.58 C26.1 10.2,23.94 9.4,23.14 v9.4,20.6 | R14.2 41.18,41.13 38.99,38.94 37.63,38.94 v36.63,37.94 | IC1.40 34.5,37.76 33.93,37.19 v33.93,37.16 | IC1.27 38.05,31.99 | IC1.111 19.5,19.1 20.78,20.37 20.78,25.45 | v15.04,26.97 15.05,26.99 IC1.92 17.73,26.99 19.27,25.45 20.78,25.45 | v5.56,18.03 5.64,17.96 5.64,17.94 4.15,19.43 R16.2
  Bottom 0.152: v22.33,29.54 22.33,29.67 23.95,31.29 v24.66,31.29 | v35.81,31.8 36.42,32.41 36.42,37.73 v36.63,37.94 36.22,38.35 35.13,38.35 v33.93,37.16 | v47.7,28.22 43.82,28.22 40.13,31.9 v39.88,31.9 | v11.79,25.96 12.8,26.97 v15.04,26.97 | v9.4,20.6 6.83,18.03 v5.56,18.03
3.3V  (via drill 0.35)
  Top 0.152: Y2.1 15.13,41.93 v17.9,39.16 17.9,39.08 IC1.72 | Y2.1 11.13,42.21 | 11.13,42.21 Y2.4 | R13.2 11.13,40.47 11.13,42.21 | 31.29,35.25 30.66,34.62 27.81,34.62 26.07,36.37 26,36.31 | R9.2 39.2,42.73 S9.6 34.75,41.71 33.5,40.46 32.18,40.46 31.5,39.78 IC1.46 31.5,35.81 31.29,35.6 31.29,35.25 | 29.92,18.85 25.86,18.85 v25.73,18.72 25.5,18.49 IC1.123 | 18.21,23.01 18.88,23.01 19.09,22.8 v19.09,20.57 | v18.52,25.12 18.52,23.31 18.21,23.01 | v40.16,30.1 40.74,30.68 v40.74,32.66 39.95,33.45 38.03,33.45 IC1.30 36.52,33.49 36.34,33.31 33.24,33.31 31.29,35.25 | v21.54,29.11 21.43,29 21.43,26.6 20.95,26.12 19.86,26.12 19,26.97 v19,27.46 17.95,28.51 16.5,28.51 | v48.72,37.16 49.28,37.16 JP5.5 | R3.2 6.01,61.65 6.85,60.81 8.5,60.81 13.22,65.52 13.22,66.66 14.33,67.77 15.57,67.77 22.68,60.65 25.32,60.65 25.99,61.32 25.99,61.89 | Y2.1 17.3,42.21 17.83,42.75 17.83,44.02 16.97,44.88 16.97,46.91 v17.32,47.27 R8.2 | IC4.8 32.21,56.74 v32.51,57.05 33.55,56.01 R10.2 | R11.2 17.82,52.47 17.73,52.37 | C15.1 v15.16,49.81 17.73,52.37 | v12.65,30.02 12.65,28.27 8.08,23.7 D2.A | v14.17,30.02 14.73,29.46 14.73,28.96 15.18,28.51 16.5,28.51 | 26,36.31 25.46,35.76 v25.12,35.76 | R12.2 21.9,58.47 | 21.9,58.47 21.9,58.57 22.4,59.08 C25.1 27.24,60.36 v27.38,60.5 25.99,61.89 | 17.73,52.37 17.73,56.44 19.76,58.47 21.9,58.47 | v15.95,16.54 15.95,16.1 15.28,15.43 C21.1 14.81,15.3 14.81,13.94 16.05,12.7 v16.15,12.7 | R6.2 42.44,58.74 | 25.99,61.89 25.99,62.14 26,62.13 R4.2 26.04,64.19 29.97,68.11 31.94,68.11 35,71.17 37.03,71.17 38.56,69.65 v38.56,69.14 37.41,68 37.41,62.3 R5.2 37.48,61.53 39.34,59.66 40.98,59.66 42.46,58.18 R6.2
  Top 0.152: R2.2 R6.2 | JP2.1 19,88.95 36.78,88.95 JP2.17 44.4,81.33 v45.67,81.33 | v44.15,79.3 v37.54,79.3 | IC1.57 26,36.31 | IC1.89 16.5,28.51 | IC1.131 29.5,18.43 29.92,18.85 | 29.92,18.85 32.58,21.51 32.6,21.49 v36.5,21.49 IC1.6 | IC1.100 18.19,22.99 18.21,23.01 | IC2.5 6.26,10.14 7.19,11.07 9.5,11.07 JP8.1 | C12.1 36.88,17.93 36.55,18.26 v36.55,20.07
  Bottom 0.152: v25.73,18.72 25.1,19.35 20.31,19.35 v19.09,20.57 19.09,19.95 15.95,16.81 v15.95,16.54 | v19,27.46 19,25.6 v18.52,25.12 | v40.16,30.1 39.07,29.01 21.64,29.01 v21.54,29.11 | v48.72,37.16 48.06,37.16 43.56,32.66 v40.74,32.66 | v27.38,60.5 30.4,60.5 32.51,58.39 v32.51,57.05 | v15.16,49.81 17.32,47.65 v17.32,47.27 | v38.56,69.14 37.54,70.15 37.54,76.25 37.03,76.76 37.03,78.79 v37.54,79.3 | v12.65,30.02 12.95,30.33 13.87,30.33 v14.17,30.02 | v25.12,35.76 20.22,35.76 17.9,38.08 v17.9,39.16 | v45.67,81.33 45.67,79.81 45.16,79.3 v44.15,79.3 | v16.15,12.7 11.33,12.7 JP8.1 | v36.55,20.07 36.5,20.12 v36.5,21.49
5V  (via drill 0.35)
  Top 0.152: 49.37,23.07 v49.37,23.42 IC3.1 49.37,25.26 49.76,25.65 50.95,25.65 51.27,25.34 IC3.3 | R19.2 49.37,23.07 | C3.1 1.75,11.33 IC2.1 0.8,10.14 0.64,9.98 0.64,8.38 0.84,8.18 1.68,8.18 IC2.3 1.75,7.55 v2.08,7.21 | v12.36,2.37 13.67,1.07 51.21,1.07 52.71,2.57 52.71,19.58 51.46,20.83 50.71,20.83 C5.1 49.37,22.17 49.37,22.35 49.37,23.07 | U$11.VBUS1 4.55,5.13 | 4.55,5.13 4.55,4.12 4.9,3.76 7.26,3.76 7.55,4.04 U$11.VBUS2 | v4.52,6.88 4.52,5.15 4.55,5.13
  Bottom 0.152: v49.37,23.42 48.57,24.22 48.57,35.64 50.9,37.97 JP5.4 | v2.08,7.21 2.41,6.88 v4.52,6.88 11.23,6.88 12.36,5.75 v12.36,2.37
ARD_DONE  (via drill 0.35)
  Top 0.152: JP3.2 8.08,39.09 8.46,38.71 v8.46,38.61 | v32.92,36.27 33,36.36 IC1.43
  Bottom 0.152: v32.92,36.27 31.22,34.57 18.9,34.57 17.98,35.48 11.58,35.48 v8.46,38.61
BLUE
  Top 0.152: 40.94,16.69 R15.2 | JP7.3 45.14,7.7 42.33,10.5 42.33,12.67 R1.2 40.81,16.81 40.94,16.69 | R20.2 41.04,16.59 40.94,16.69
BLUE_1
  Top 0.152: R1.1 42.81,14.21 41.96,15.06 41.96,21.54 JP10.3 41.72,21.78 41.72,22.01 40.74,22.99 IC1.9
BLUE_2
  Top 0.152: R15.1 42.85,19.36 42.85,22.61 41.97,23.49 IC1.10
BLUE_3
  Top 0.152: IC1.2 39.14,19.49 39.27,19.35 39.27,16.77 R20.1
CS  (via drill 0.35)
  Top 0.152: JP3.3 6.81,36.55 7.9,37.64 16.79,37.64 26.77,27.66 26.77,25.96 v31.06,21.67 | IC1.141 34.5,18.6 v34.7,18.8
  Bottom 0.152: v31.06,21.67 32.26,20.47 33.02,20.47 v34.7,18.8
D0  (via drill 0.35)
  Top 0.152: JP4.1 48.69,48.72 48.69,46.96 v47.17,45.44 | v49.15,60.86 49.15,69.65 48.34,70.46 48.34,73.66 49.78,75.11 v49.78,76.3 | IC1.34 36.93,35.49 36.7,35.71 36.7,36.47 37.96,37.73 39.51,37.73 v40.61,38.84
  Bottom 0.152: v47.17,45.44 40.61,38.89 v40.61,38.84 | JP4.1 50.32,50.85 49.15,52.02 v49.15,60.86 | JP2.16 36.78,88.95 40.08,88.95 49.78,79.25 v49.78,76.3
D1  (via drill 0.35)
  Top 0.152: JP4.2 v47.23,49.8 47.22,49.78 v47.22,46.74 | v39.5,35.43 39.5,35.41 39.13,35.04 38.05,35.04 IC1.33 | v46.71,68.94 v46.71,66.19
  Bottom 0.152: v47.22,46.74 39.52,39.04 39.52,35.46 v39.5,35.43 | v46.71,68.94 47.89,70.11 47.89,72.66 42.79,77.76 42.63,77.76 35.51,84.89 JP2.15 | v47.23,49.8 46.18,50.85 46.18,65.66 v46.71,66.19
D2  (via drill 0.35)
  Top 0.152: v42.39,37.97 42.39,37.52 39.36,34.49 IC1.32 | v46.28,43.15 46.33,43.21 46.33,51.43 v47.23,52.34 JP4.3 | v48.21,66.09 v48.21,68.12
  Bottom 0.152: v46.28,43.15 42.39,39.27 v42.39,37.97 | v47.23,52.34 47.23,65.11 v48.21,66.09 | v48.21,68.12 48.21,72.75 51.26,75.79 51.26,79.81 39.07,92 35.51,92 33.73,90.22 JP2.14
D3  (via drill 0.35)
  Top 0.152: v47.4,44.22 47.4,44.45 52.35,49.4 52.35,57.61 51.49,58.47 JP4.4 | v42.49,36.55 42.49,36.42 40.12,34.05 38.05,34.05 IC1.31 | v49.68,62.26 49.58,62.36 49.58,64.11 49.76,64.29 49.76,69.62 48.74,70.64 48.74,71.86 50.39,73.51 50.39,77.16 47.42,80.14 v44.83,80.14 | JP2.13 37.8,82.85 41.33,82.85 v42.37,81.81
  Bottom 0.152: v42.49,36.55 42.49,36.58 47.4,41.48 v47.4,44.22 | JP4.4 49.68,59.62 v49.68,62.26 | v42.37,81.81 44.04,80.14 v44.83,80.14
D4  (via drill 0.35)
  Top 0.152: v18.67,66.78 19.53,67.64 19.53,74.96 19.71,75.13 19.71,75.18 v19.76,75.23 | v16.89,64.77 15.19,64.77 3.78,53.37 JP1.5 1.85,53.37 1.02,52.53 1.02,44.78 2.21,43.59 4.98,43.59 10.13,38.43 16.59,38.43 22.19,32.83 36.53,32.83 36.69,32.99 IC1.29 | v19.94,79.5 23.11,79.5 24.89,81.28 28.4,81.28 28.85,81.74 29.49,81.74 31.22,80.01 v32.39,80.01
  Bottom 0.152: v16.89,64.77 18.67,66.55 v18.67,66.78 | v19.76,75.23 19.76,79.32 v19.94,79.5 | v32.39,80.01 32.39,85.67 31.65,86.41 31.65,89.61 31.04,90.22 JP2.12
D5  (via drill 0.35)
  Top 0.152: v23.52,31.83 23.55,31.85 23.72,31.85 24.36,32.49 IC1.28 | v21.29,29.95 19.76,29.95 18.97,30.73 v18.16,30.73 | JP2.11 30.43,86.92 28.4,84.89 27.72,84.89 25.52,82.68 25.18,82.68 v24.33,81.84 | v8.1,55.93 6.76,54.58 6.76,53.52 4.06,50.83 JP1.6
  Bottom 0.152: v23.52,31.83 21.64,29.95 v21.29,29.95 | v18.16,30.73 12.78,30.73 4.04,39.47 4.04,42.77 3.18,43.64 2.16,43.64 1.07,44.73 1.07,49.76 2.13,50.83 JP1.6 | v8.1,55.93 8.2,56.03 8.2,60.93 1.73,67.41 1.73,74.7 4.47,77.44 5.82,77.44 7.96,79.59 7.96,80.94 8.69,81.66 24.16,81.66 v24.33,81.84
D6  (via drill 0.35)
  Top 0.152: v19.41,32.71 20.85,32.71 23.45,30.12 23.67,30.12 25.78,28 v25.78,27.23 | v27.81,26.09 31.75,30.02 v31.75,30.07 | v33.6,31.01 33.89,31.3 36.57,31.3 36.78,31.51 36.8,31.49 IC1.26 | v15.49,89.41 16.48,89.41 16.84,89.05 18.34,89.05 18.97,89.69 18.97,90.73 19.63,91.39 26.72,91.39 JP2.10
  Bottom 0.152: v19.41,32.71 12.17,32.71 4.98,39.9 4.98,45.87 JP1.7 4.24,49.96 4.24,51.21 3.43,52.02 1.73,52.02 1.17,52.58 1.17,55.96 1.35,56.13 1.35,75.64 1.35,75.74 1.35,79.58 5.19,83.43 9.03,83.43 15.11,89.51 15.57,89.51 15.49,89.43 v15.49,89.41 | v25.78,27.23 26.92,26.09 v27.81,26.09 | v31.75,30.07 32.69,31.01 v33.6,31.01
D7  (via drill 0.35)
  Top 0.152: v25.15,30.23 25.93,31.01 31.88,31.01 32.83,30.05 34.15,30.05 35.08,30.99 IC1.25 | v23.47,29.64 23.19,29.64 21.51,31.32 18.97,31.32 v18.24,32.05 | JP1.8 4.78,45.75 7.98,48.95 7.98,53.87 12.04,57.94 v12.17,57.94 | v15.7,79.02 15.77,78.94 27.25,78.94 28.25,79.93 v28.27,79.93
  Bottom 0.152: v25.15,30.23 24.56,29.64 v23.47,29.64 | v18.24,32.05 12.14,32.05 4.52,39.67 4.52,43.79 JP1.8 | v12.17,57.94 12.17,69.54 11.56,70.15 11.56,72.59 12.17,73.2 12.17,75.72 15.47,79.02 v15.7,79.02 | v28.27,79.93 30.43,82.09 30.43,85.14 JP2.9
FPGA_CLK  (via drill 0.35)
  Top 0.152: Y2.3 13.98,44.25 16.71,44.25 17.22,43.74 v17.22,43.23 | IC1.49 30,40.18 30,40.27 30,40.35 v29.36,41
  Bottom 0.152: v17.22,43.23 17.22,37.13 19.25,35.1 25.86,35.1 27.89,37.13 27.89,40.44 28.45,41 v29.36,41
GND  (via drill 0.35)
  Top 0.152: 24.26,35.84 20.88,35.84 20,36.71 IC1.69 | 30.53,15.19 32.82,15.19 v32.84,15.21 32.87,15.19 33.22,15.19 34,15.97 IC1.140 34,19.88 v35.13,21.01 35.15,20.99 IC1.5 | v18.36,22.5 18.36,21.84 18.01,21.49 IC1.103 15.31,21.49 15.3,21.51 15.18,21.51 14.96,21.28 v14.96,20.88 14.96,18.72 15.52,18.16 | v20.14,26.82 20.14,28.5 v19.43,29.21 18.65,29.99 IC1.86 16.5,30.01 15.49,30.01 15.09,30.4 15.09,34.19 v14.83,34.44 | U$1.6 U$1.7 U$1.8 28.26,7.81 27.38,8.69 24.95,8.69 U$1.10 22.54,8.56 U$1.5 22.54,12.05 22.25,12.34 v21.31,12.34 | 30.53,15.19 v26.19,15.19 17.73,15.19 17.4,15.52 17.4,17.09 17.09,17.4 16.28,17.4 15.52,18.16 | S7.3 46.99,29.77 | 47.07,31.47 S7.4 47.85,36.14 47.85,38.84 49.63,40.61 JP5.3 JP5.2 | 47.07,31.47 S7.3 | IC3.2 50.32,23.75 51.09,22.97 C5.2 52.38,23.43 52.38,28.53 C27.2 51.15,30.89 50.57,31.47 47.07,31.47 | IC4.4 v23.83,52.93 23.14,52.93 21.44,51.23 18.43,51.23 17.02,49.82 v17.02,49.79 17,49.81 16.99,49.81 15.13,47.95 15.13,47.32 | 15.13,47.32 Y2.2 | 24.26,35.84 23.62,35.2 v23.62,33.38 | S2.2 S3.2 S4.2 | JP2.18 38.05,90.73 36.6,92.18 19.02,92.18 17.73,90.88 JP2.2 13.26,90.22 10.87,87.83 S2.2 | v11.76,21.03 11.4,21.39 C26.2 | v13.03,34.87 12.93,34.98 12.93,36.73 12.45,37.21 10.62,37.21 10.31,36.91 R23.2 | S2.2 10.87,73.71 11.25,73.33 11.25,70 12.55,68.71 15.62,68.71 18.24,66.09 v19.76,66.09 | v28.91,61.01 28.94,60.97 28.94,59.11 | 28.94,59.11 C25.2 | 28.94,59.11 30.18,59.11 v30.43,58.85 32.59,58.85 32.97,58.47 36.02,58.47 37.26,57.23 v37.31,57.23 | C15.2 12.08,49.21 13.97,47.32 15.13,47.32 | v24.03,44.55 26.37,44.55 27.13,43.79 S9.3 27.13,41.81 25,39.69 IC1.59 25,36.59 24.26,35.84
  Top 0.152: C12.2 36.54,13.39 v35.41,13.39 | C21.2 15.52,17.97 15.52,18.16 | LED1.C 42.18,54.2 42.18,54.31 v39.24,57.25 | LED6.C 47.53,27.56 47.05,28.05 47.07,28.07 S7.3 | S7.3 46.53,29.77 43.23,26.47 43.13,26.47 41.88,25.21 37.99,25.21 | IC1.13 37.99,25.21 | 37.99,25.21 IC1.14 | 37.99,25.21 36.29,25.21 v36.02,24.94 | IC1.132 30,15.72 30.53,15.19 | IC2.2 2.79,9.19 2.92,9.32 | C3.2 3.85,11.31 3,10.46 3,9.4 2.92,9.32 | 2.92,9.32 2.92,5.73 U$11.GND1 3.3,3.82 4.01,3.1 8.08,3.1 8.8,3.82 U$11.GND2 8.8,7.63 JP8.2
  Bottom 0.152: v18.36,22.5 20.14,24.28 v20.14,26.82 | v21.31,12.34 24.16,15.19 v26.19,15.19 | v23.62,33.38 19.45,29.21 v19.43,29.21 | v14.96,20.88 11.91,20.88 v11.76,21.03 | v13.03,34.87 13.46,34.44 v14.83,34.44 | v35.13,21.01 35.13,24.05 v36.02,24.94 | v19.76,66.09 23.85,62 28.42,62 28.91,61.52 v28.91,61.01 | v23.83,52.93 28.75,57.86 30.18,57.86 30.43,58.11 v30.43,58.85 | v24.03,44.55 19,49.58 17.23,49.58 v17.02,49.79 | v35.41,13.39 35.41,13.44 34.62,13.44 v32.84,15.21 | v37.31,57.23 39.22,57.23 v39.24,57.25 | U$1.5 20.89,11.61 14.05,11.61 10.87,8.43 JP8.2
  pour Bottom: 53.52,0.03 0,0.03 0,95 53.52,95
  pour Top: -0.05,95.05 53.34,95.05 53.34,0.08 2.97,0.08 -0.05,3.1
GREEN
  Top 0.152: 44.82,16.78 R17.2 44.82,11.57 47.68,8.71 JP7.2 | R18.2 44.82,19.23 44.82,16.81 44.82,16.78 | R22.2 44.82,16.78
GREEN_1
  Top 0.152: R17.1 46.82,14.57 45.95,15.44 45.95,20.07 45.59,20.42 43.79,20.42 43.23,20.98 43.23,23.32 42.56,23.99 IC1.11
GREEN_2
  Top 0.152: IC1.12 42.98,24.49 44.09,23.37 44.09,22.63 44.23,22.49 44.32,22.4 JP10.2 45.01,21.72 46.85,19.88 R18.1
GREEN_3  (via drill 0.35)
  Top 0.152: IC1.3 39.3,19.99 39.93,19.35 v39.93,18.14 | v42.82,17.75 43.02,17.56 R22.1
  Bottom 0.152: v39.93,18.14 40.41,17.65 42.72,17.65 v42.82,17.75
H_SYNC
  Top 0.152: U$1.13 27.12,3.7 26.31,2.9 21.49,2.9 19.76,4.62 19.76,7.85 12.65,14.96 12.65,26.81 13.63,27.79 13.63,34.05 14.58,35.01 16.5,35.01 IC1.76
HS  (via drill 0.35)
  Top 0.152: JP3.1 4.09,41.63 v5.49,40.23 | IC1.38 35.5,36.95 35.43,36.88 v35.43,36.75
  Bottom 0.152: v5.49,40.23 11.86,33.86 32.56,33.86 35.43,36.73 v35.43,36.75 | JP3.1 0.53,43.64 0.53,80.39 10.63,90.49 15.71,90.49 17.22,92 21.06,92 22.73,90.32 22.73,90.3 JP2.6
ICE_CDONE  (via drill 0.35)
  Top 0.152: S9.2 24.59,41.66 23.37,40.44 v23.06,40.44 22.33,40.44 22,40.11 IC1.65 | v18.49,43.08 18.49,45.24 R8.1
  Bottom 0.152: v23.06,40.44 22.33,39.7 18.64,39.7 17.91,40.44 17.91,42.49 v18.49,43.08
ICE_CREST
  Top 0.152: S7.1 S7.2 43.26,43.51 40.63,46.14 | 40.63,46.14 R9.1 | 40.63,46.14 35.72,46.14 33.58,43.99 33.58,41.63 32.97,41.02 31.38,41.02 S9.4 29.67,43.99 28.52,45.14 23.6,45.14 23.11,44.65 23.11,41.43 22.73,41.05 22.2,41.05 21.5,40.35 IC1.66
ICE_MISO  (via drill 0.35)
  Top 0.152: v33.27,46.02 34.75,47.5 S9.7 36.02,50.43 36.02,55.75 34.14,57.63 24.26,57.63 23.75,57.12 23.75,55.83 24.1,55.47 IC4.2 | IC1.68 20.5,40.01 v20.8,40.31
  Bottom 0.152: v20.8,40.31 26.52,46.02 v33.27,46.02
ICE_MOSI  (via drill 0.35)
  Top 0.152: v33.12,47.45 32.21,48.36 S9.8 32.21,51.58 IC4.5 | IC1.67 21,37.42 v21.79,36.63
  Bottom 0.152: v21.79,36.63 24.33,39.17 24.33,39.67 28.91,44.25 33.48,44.25 35,45.77 33.33,47.45 v33.12,47.45
ICE_SCK  (via drill 0.35)
  Top 0.152: R13.1 16.03,39.62 18.52,37.13 19.25,37.13 19.51,37.39 IC1.70 19.5,44.04 21.54,46.08 25.65,46.08 27.13,47.55 S9.10 27.13,53.19 v27.53,53.59 | v29.18,54.3 30.75,54.3 IC4.6
  Bottom 0.152: v27.53,53.59 28.25,54.3 v29.18,54.3
ICE_SS_B  (via drill 0.35)
  Top 0.152: S9.5 32.21,43.31 29.97,45.54 28.8,45.54 | 28.8,45.54 22.15,45.54 20.35,43.74 20.35,41.48 v20.27,41.48 | IC4.1 26.9,56.74 v28.05,55.59 28.5,55.14 28.5,45.85 28.8,45.54 | v21.9,55.04 R12.1 | IC1.71 v19,40.38 v19,40.39
  Bottom 0.152: v20.27,41.48 19.18,40.39 v19,40.39 | v21.9,55.04 21.9,53.39 23.17,52.12 24.59,52.12 v28.05,55.59
KEY_1  (via drill 0.35)
  Top 0.152: v42.14,70.41 39.48,67.75 R5.1 40.51,61.2 v40.51,60.68 | v36.08,44.82 38.11,44.82 v38.56,45.26 | IC1.48 30.5,37.72 29.79,37.01 v29.03,37.01
  Bottom 0.152: S4.1 41.48,73.58 41.48,73 42.14,72.34 v42.14,70.41 | v29.03,37.01 28.6,37.44 28.6,40.13 28.91,40.44 31.72,40.44 36.09,44.81 v36.08,44.82 | v38.56,45.26 40.59,47.29 40.59,60.6 v40.51,60.68
KEY_2  (via drill 0.35)
  Top 0.152: v29.44,15.75 29.39,15.7 28.58,15.7 28.5,15.77 IC1.129 | v23.83,69.14 23.83,62.35 R4.1
  Bottom 0.152: v29.44,15.75 50.17,15.75 52.27,17.86 52.27,65.02 50.27,67.03 37.11,67.03 34.98,69.16 30.91,69.16 29.95,70.13 29.95,72.19 28.42,73.71 S3.1 | 24.33,73.71 S3.1 | S3.1 23.83,73.05 v23.83,69.14
KEY_3  (via drill 0.35)
  Top 0.152: v10.11,27.48 11.56,28.93 11.56,36.55 v11.63,36.63 | v9.45,50.01 9.45,53.62 v9.35,53.72 | R3.1 8.01,66.97 v6.66,68.33 5.54,69.44 5.54,70.66 5.03,71.17 5.03,73.2 S2.1 | IC1.128 28,16.02 v27.74,15.75
  Bottom 0.152: v27.74,15.75 20.12,15.75 18.87,16.99 17.7,16.99 17.22,16.51 17.22,16.26 16.41,15.44 15.37,15.44 14.5,16.31 11.71,16.31 10.11,17.91 v10.11,27.48 | v11.63,36.63 11.63,47.8 9.45,49.99 v9.45,50.01 | v9.35,53.72 9.35,65.63 v6.66,68.33
MISO  (via drill 0.35)
  Top 0.152: v16.71,13.77 33.99,13.77 36.07,15.85 36.07,16.94 IC1.144 | v11.33,13.64 10.64,12.95 1.78,12.95 0.97,13.77 0.97,30.02 2.41,31.47 JP3.5
  Bottom 0.152: v16.71,13.77 16.59,13.64 v11.33,13.64
MOSI  (via drill 0.35)
  Top 0.152: v17.83,14.48 33.68,14.48 34.75,15.54 35,15.8 IC1.142 | v10.16,14.81 5.03,19.94 5.03,31.04 6.92,32.93 R21.1 5.17,32.93 4.09,34.01 JP3.4
  Bottom 0.152: v17.83,14.48 16.18,14.48 16.08,14.38 10.59,14.38 v10.16,14.81
N$1
  Top 0.152: IC4.7 31.39,55.47 33.41,53.46 R10.1
N$2
  Top 0.152: LED6.A 45.43,25.01 R19.1
N$4
  Top 0.152: IC4.3 20.32,54.2 R11.1
N$9  (via drill 0.35)
  Top 0.152: R14.1 41.97,38.7 v40.74,37.46 40.28,37.01 v38.94,37.01 | C22.1 C23.1 44.35,38.01 v44.35,36.52 | IC1.54 27.5,36.53 28.12,35.92 30.56,35.92 30.86,36.22 v30.86,36.3 | v32.08,36.83 32.08,35.79 34.16,33.71 35.66,33.71 36.04,34.09 36.04,36.4 37.97,38.33 v38.63,38.33
  Bottom 0.152: v40.74,37.46 40.79,37.46 42.34,35.92 43.79,35.92 44.35,36.47 v44.35,36.52 | v30.86,36.3 31.39,36.83 v32.08,36.83 | v38.63,38.33 38.63,37.31 v38.94,37.01
N$11
  Top 0.152: R7.1 44.31,54.23 LED1.A
N$12
  Top 0.152: R7.2 40.72,52.12 40.72,48.08 42.24,46.56 42.24,46.08 47.35,40.97 47.35,37.32 45.56,35.53 45.56,29.63 43.93,28.01 38.01,28.01 IC1.19
N$13  (via drill 0.35)
  Top 0.152: v11.1,18.36 10.34,18.36 8.08,20.63 D2.C | v16.48,18.26 16.58,18.35 16.58,18.93 IC1.108
  Bottom 0.152: v11.1,18.36 11.2,18.26 v16.48,18.26
N$20
  Bottom 0.152: U$1.3 28.39,8.69 34.47,8.69 35.99,7.16 35.99,4.83 37.62,3.2 43.61,3.2 JP6.1
N$21  (via drill 0.35)
  Top 0.152: v34.91,3.87 34.91,8.37 33.33,9.96 U$1.1
  Bottom 0.152: v34.91,3.87 35.08,4.04 36.65,2.46 49.23,2.46 50.29,3.53 JP6.3
N$22  (via drill 0.35)
  Top 0.152: R16.1 2.15,17.73 C1.1 C2.1 2.35,15.6 2.35,14.46 3.18,13.64 10.41,13.64 11.18,14.4 11.79,14.4 15.29,10.9 v15.7,10.9 | IC1.126 27,18.13 v26.85,18.29 | v16.71,16.54 16.71,15.21 15.9,14.4 15.9,13.61 16.31,13.21 18.24,13.21 19.84,11.61 v19.84,10.67
  Bottom 0.152: v26.85,18.29 26.59,18.03 18.06,18.03 16.71,16.69 v16.71,16.54 | v19.84,10.67 19.38,10.21 16.38,10.21 v15.7,10.9
N$23
  Bottom 0.152: U$1.2 29.41,10.51 30.3,11.4 40.18,11.4 43.49,8.1 43.49,6.86 44.02,6.32 46.23,6.32 JP6.2
N$25  (via drill 0.35)
  Top 0.152: IC1.127 27.5,16.3 27,15.8 18.39,15.8 v17.92,16.27 18.01,16.18 | v5.54,16.81 4.8,17.55 C1.2 C2.2
  Bottom 0.152: v17.92,16.27 16.69,15.04 11.38,15.04 9.6,16.81 v5.54,16.81
N$26  (via drill 0.35)
  Top 0.152: v45.52,36.37 46.06,36.92 C23.2 C22.2 | IC1.53 28,36.84 28.4,36.45 v30.1,36.45 | v35.73,30.41 36.53,29.62 v36.73,29.62
  Bottom 0.152: v45.52,36.37 44.63,35.48 42.62,35.48 42.16,35.03 42.16,33.68 41.76,33.27 40.06,33.27 39.17,32.38 39.17,31.14 37.64,29.62 v36.73,29.62 | v30.1,36.45 31.04,37.39 32.79,37.39 33.53,36.65 33.53,36.35 33.76,36.12 34.06,36.12 35.26,37.31 35.74,37.31 36.02,37.03 36.02,33.27 35.2,32.46 35.2,30.94 v35.73,30.41
PCLK  (via drill 0.35)
  Top 0.152: JP1.3 2.13,58.45 0.89,59.69 0.89,74.65 8.59,82.35 v9.96,82.35 | v20.27,82.35 23.83,82.35 25.35,83.87 JP2.7 | IC1.20 38.01,28.51 39.81,28.51 41.48,30.17 41.48,33.83 v41.4,33.91
  Bottom 0.152: v41.4,33.91 40.59,34.72 38.94,34.72 38.91,34.7 37.8,35.81 37.8,47.57 33.86,51.51 10.26,51.51 3.33,58.45 JP1.3 | v9.96,82.35 9.98,82.32 20.24,82.32 v20.27,82.35
RED
  Top 0.152: 48.99,16.81 R25.2 48.97,14.18 48.97,10.97 50.24,9.7 50.22,9.68 JP7.1 | 48.99,16.81 R26.2 | 48.99,16.81 48.98,16.81 R24.2
RED_1  (via drill 0.35)
  Top 0.152: R25.1 50.99,16.83 49.91,17.91 49.91,20.12 49.35,20.68 v48.54,20.68 | IC1.7 38.87,21.99 39.37,21.49 v39.37,21.28
  Bottom 0.152: v48.54,20.68 48.08,20.22 40.44,20.22 v39.37,21.28
RED_2  (via drill 0.35)
  Top 0.152: v50.14,20.73 50.99,19.88 R26.1 | IC1.8 39.36,22.49 v39.55,22.3
  Bottom 0.152: v39.55,22.3 40.67,23.42 47.83,23.42 50.14,21.11 v50.14,20.73
RED_3  (via drill 0.35)
  Top 0.152: IC1.1 37.99,18.09 v38.25,17.83 | R24.1 46.98,17.76 v46.94,17.81 47.55,17.81 47.85,18.11 47.85,20.78 47.47,21.16 46.91,21.72 | 46.91,21.72 46.89,21.74 | JP10.1 46.91,21.72
  Bottom 0.152: v38.25,17.83 39.4,16.69 45.82,16.69 v46.94,17.81
SCL  (via drill 0.35)
  Top 0.152: v38.35,40 34.8,40 34,39.21 IC1.41 | JP4.6 51.51,64.24 51.51,69.16 52.02,69.67 52.02,76.68 47.88,80.82 31.5,80.82 29.64,82.68 v26.19,82.68 | v48.41,62.18 46.99,60.76 R2.1
  Bottom 0.152: v38.35,40 48.41,50.06 v48.41,62.18 49.78,63.55 JP4.6 | v26.19,82.68 26.16,82.7 22.91,82.7 20.27,85.34 JP2.3
SCLK  (via drill 0.35)
  Top 0.152: JP3.6 4.09,28.93 v4.52,28.5 | IC1.143 v35.5,19.35 v35.51,19.35
  Bottom 0.152: v4.52,28.5 26.37,28.5 v35.51,19.35
SDA  (via drill 0.35)
  Top 0.152: v44.91,45.64 45.03,45.64 45.67,46.28 45.67,52.98 47.22,54.53 47.22,57.94 47.73,58.45 | v42.11,42.87 39.75,40.51 34.65,40.51 33.5,39.37 IC1.42 | 47.73,58.45 50.29,61.01 JP4.5 51.18,61.01 52.5,62.33 52.5,77.85 45.31,85.04 v42.04,85.04 | v28.14,84.07 29.49,84.07 32.11,81.46 40.49,81.46 v41,81.97 | 47.73,58.45 47.73,58.72 R6.1
  Bottom 0.152: v44.91,45.64 42.14,42.87 v42.11,42.87 | v28.14,84.07 26.62,84.07 24.08,86.61 24.08,88.34 23.44,88.98 21.51,88.98 JP2.4 | v42.04,85.04 41,84 v41,81.97
V_SYNC
  Top 0.152: U$1.14 23.56,6.15 21.95,6.15 13.28,14.81 13.28,26.09 15.2,28.01 16.5,28.01 IC1.90
VS  (via drill 0.35)
  Top 0.152: v36.83,39.27 36.83,39.26 36.79,39.26 IC1.37 | JP1.4 4.93,55.91 14.35,65.33 v14.35,65.94 | JP2.5 22.81,85.9 22.3,85.39 20.65,85.39 18.29,83.03 18.29,79.86 v18.24,79.81
  Bottom 0.152: v36.83,39.27 36.83,46.08 32.26,50.65 9.25,50.65 3.99,55.91 JP1.4 | v14.35,65.94 18.24,69.82 v18.24,79.81
XCLK  (via drill 0.35)
  Top 0.152: R21.2 8.59,30.95 R23.1 10.31,29.74 v9.91,29.34 | v18.42,29.11 v19.53,27.99 | v28.93,24.84 31.8,24.84 34.82,27.86 v34.82,29.51 | v34.87,34.26 34.57,34.57 34.57,36.98 34.99,37.4 34.99,38.46 IC1.39 | v35.43,69.98 35.43,61.72 38.41,58.75 38.41,48.46 v37.19,47.24 | v29.82,84.78 32.82,84.78 35.56,82.04 v35.56,81.99
  Bottom 0.152: v9.91,29.34 9.91,29.18 18.34,29.18 v18.42,29.11 | v19.53,27.99 19.86,27.66 24.31,27.66 27.31,24.66 28.75,24.66 v28.93,24.84 | v34.87,34.26 34.8,34.19 34.8,29.54 v34.82,29.51 35.74,29.51 37.08,30.86 37.08,37.01 37.39,37.31 37.39,38.66 37.39,47.04 v37.19,47.24 | JP2.8 26.64,88.93 26.64,86.64 28.5,84.78 v29.82,84.78 | v35.43,69.98 35.51,70.05 35.51,79.25 35.56,79.3 v35.56,81.99

### Text on the board
tPlace: GND | SDA | HS | X / CLK | D6 | D4 | D2 | D0 | PDN | OV7670 / CAMERA | SCL | VS | P / CLK | D7 | D5 | D3 | D1 | !RST | 3.3V | A - 128 | B - 129 | C - 48 | ARDUINO UNO | ARDUINO UNO | SCL | 10K | 10K | 10K | SDA | 10K | CAP | PCLK | 10K | D3 | FLASH | 10K | 10K | VS | D2 | 10K | LED 19 | D4 | MOSI | MISO | D1 | D5 | 1K | D0 | CAP | SCK | PROGRAMMING | D6 | 10K | D7 | 10K | GND | HS | 100MHz | DON | GND | RST | SS | 3.3V | CAP | GND | DONE | 100Ω | 5V | 10K | CS | CAP | HARD RESET | 3.3V | MOSI | MISO | CAP | 4.7K | 4.7K | SCLK | 1.2V | PWR / LED | DIODE | CAP | iCE40HX4K-TQ144 | B1 | G2 | R3 | CAP | 1K | 1K | 1K | CAP | VGA VIDEO OUT | 2K | 2K | 2K | CAP | 470Ω | 470Ω | 470Ω | 3.3V | FROM CAMERA | BLU | GRN | RED | GND | BLU | GRN | RED | VGA OUT
bPlace: GND | BLU | GRN | RED | VS | HS